# Altium schematic sheet 电路图.SchDoc
size A3
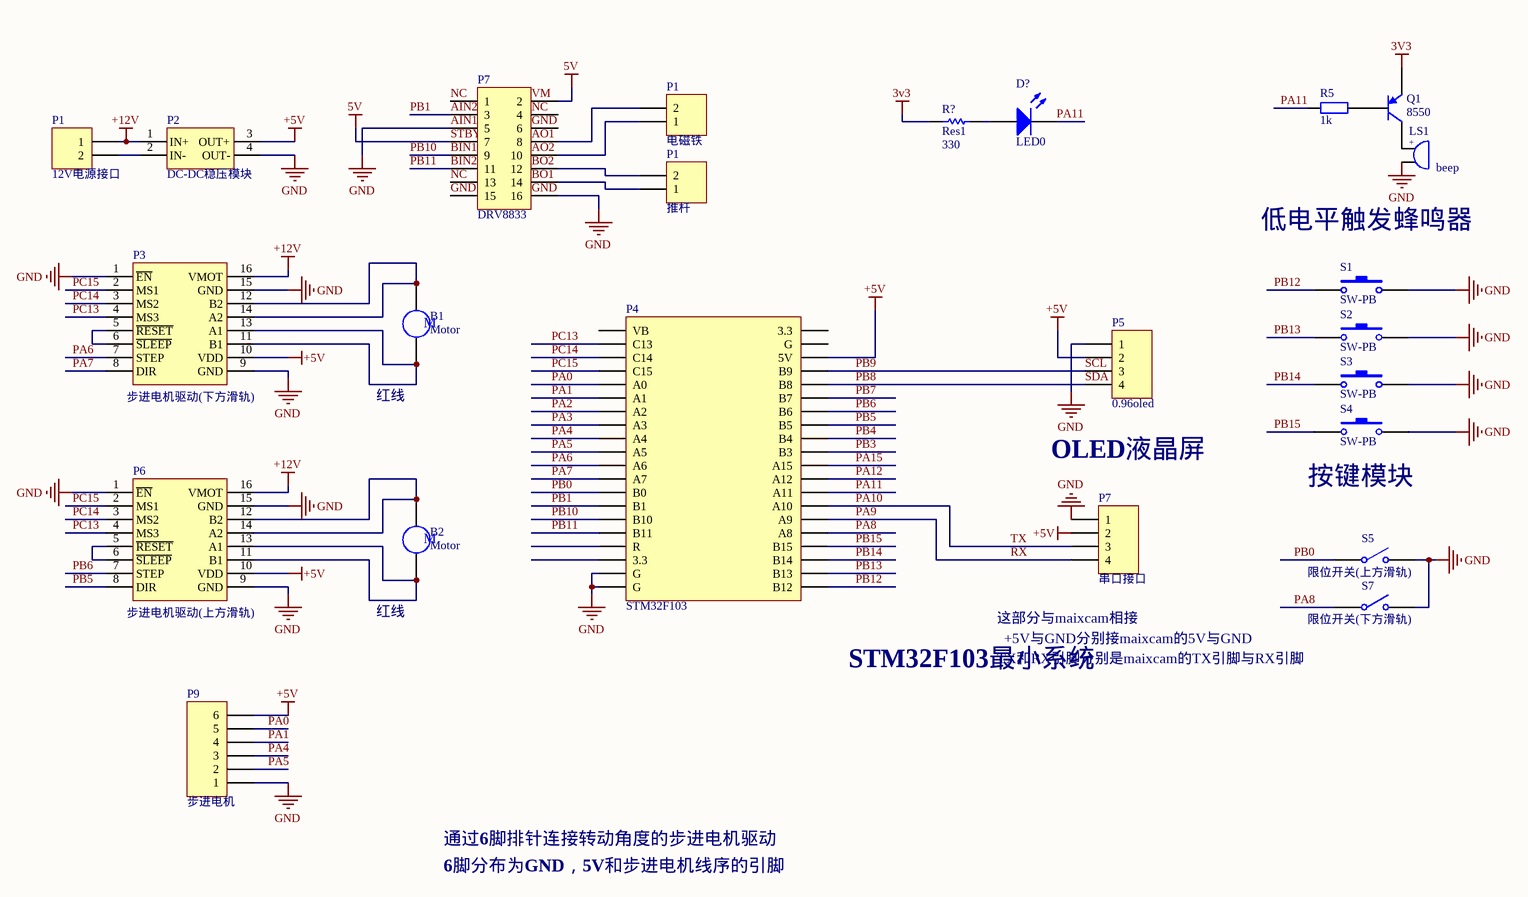
[diagram p0: 电路图.SchDoc]

## Parts
(Parts that share a designator on the sheet are numbered #1, #2 ... from top to bottom, then left to right.)
B1  Motor  [RB5-10.5]
B2  Motor  [RB5-10.5]
D?  LED0  [LED-0]
LS1  beep  [BEEP 5x9x5.5]
P1#1  12V电源接口  [HDR1X2]
P1#2  电磁铁  [HDR1X2]
P1#3  推杆  [HDR1X2]
P2  DC-DC稳压模块
P3  步进电机驱动(下方滑轨)
P4  STM32F103  [HDR2X20]
P5  0.96oled  [HDR1X4]
P6  步进电机驱动(上方滑轨)
P7#1  DRV8833  [HDR2X8H]
P7#2  串口接口  [HDR1X4]
P9  步进电机  [HDR1X6]
Q1  8550  [TO-92A]
R5  1k  [R 0805_L]
R?  Res1  value 330  [AXIAL-0.3]
S1  SW-PB  [SPST-2]
S2  SW-PB  [SPST-2]
S3  SW-PB  [SPST-2]
S4  SW-PB  [SPST-2]
S5  限位开关(上方滑轨)  [SMT-KEY]
S7  限位开关(下方滑轨)  [SMT-KEY]

## Nets
3v3: Q1.1(E) R?.1
+5V: P2.3(OUT+) P3.10(VDD) P4.35(5V) P5.2 P6.10(VDD) P7#2.2 P9.6
+12V: P1#1.1 P2.1(IN+) P3.16(VMOT) P6.16(VMOT)
AIN1: LS1.2 P2.4(OUT-) P3.1(~{EN}) P3.9(GND) P3.15(GND) P4.2(G) P4.4(G) P5.1 P6.1(~{EN}) P6.9(GND) P6.15(GND) P7#1.5 P7#1.15 P7#1.16 P7#2.1 P9.1 S1.1 S2.1 S3.1 S4.1 S5.2(NO) S7.2(NO)  [also labelled GND]
STBY: P7#1.2 P7#1.7  [also labelled 5V]
AIN2: P4.14(B1) P7#1.3  [also labelled PB1]
BIN1: P4.12(B10) P7#1.9  [also labelled PB10]
BIN2: P4.10(B11) P7#1.11  [also labelled PB11]
NC: P7#1.1 P7#1.13
PA0: P4.32(A0) P9.5
PA1: P4.30(A1) P9.4
PA2: P4.28(A2)
PA3: P4.26(A3)
PA4: P4.24(A4) P9.3
PA5: P4.22(A5) P9.2
PA6: P3.7(STEP) P4.20(A6)
PA7: P3.8(DIR) P4.18(A7)
PA8: P4.9(A8) S7.1(COMMON)
PA9: P4.11(A9) P7#2.4  [also labelled RX]
PA10: P4.13(A10) P7#2.3  [also labelled TX]
PA11: D?.2(K) P4.15(A11) R5.1
PA12: P4.17(A12)
PA15: P4.19(A15)
PB0: P4.16(B0) S5.1(COMMON)
PB3: P4.21(B3)
PB4: P4.23(B4)
PB5: P4.25(B5) P6.8(DIR)
PB6: P4.27(B6) P6.7(STEP)
PB7: P4.29(B7)
PB8: P4.31(B8) P5.4  [also labelled SDA]
PB9: P4.33(B9) P5.3  [also labelled SCL]
PB12: P4.B12 S1.2
PB13: P4.3(B13) S2.2
PB14: P4.5(B14) S3.2
PB15: P4.7(B15) S4.2
PC13: P3.4(MS3) P4.38(C13) P6.4(MS3)
PC14: P3.3(MS2) P4.36(C14) P6.3(MS2)
PC15: P3.2(MS1) P4.34(C15) P6.2(MS1)
NetB1_1: B1.1 P3.12(B2) P3.14(A2)
NetB1_2: B1.2 P3.11(B1) P3.13(A1)
NetB2_1: B2.1 P6.12(B2) P6.14(A2)
NetB2_2: B2.2 P6.11(B1) P6.13(A1)
NetD?_1: D?.1(A) R?.2
NetLS1_1: LS1.1 Q1.3(C)
NetP1#1_2: P1#1.2 P2.2(IN-)
NetP1#2_1: P1#2.1 P7#1.10
NetP1#2_2: P1#2.2 P7#1.8
NetP1#3_1: P1#3.1 P7#1.14
NetP1#3_2: P1#3.2 P7#1.12
NetP3_5: P3.5(~{RESET}) P3.6(~{SLEEP})
NetP6_5: P6.5(~{RESET}) P6.6(~{SLEEP})
NetQ1_2: Q1.2(B) R5.2

Not connected (* = marked no-connect by the designer): P4 6(3.3) 8(R) 37(G) 39(3.3) 40(VB); P7#1 4 6

## Notes on the sheet
- 低电平触发蜂鸣器
- 红线
- OLED液晶屏
- (near S4) 按键模块
- STM32F103最小系统
- (near P7#2) 这部分与maixcam相接
- TX和RX引脚分别是maixcam的TX引脚与RX引脚
- +5V与GND分别接maixcam的5V与GND
- 通过6脚排针连接转动角度的步进电机驱动
- 6脚分布为GND，5V和步进电机线序的引脚
- Labels drawn without touching a wire or pin: AO1, AO2, BO1, BO2, GND, NC, VM
- (in symbol BEEP) +
- (in symbol Motor) M

## Library data of the parts
B1 B2 = Motor: Motor, General Kind; Published: 24-Mar-1999; LatestRevisionDate: 17-Jul-2002; LatestRevisionNote: Re-released for DXP Platform.; PackageReference: RB5-10.5; Publisher: Altium Limited; PackageDescription: Capacitor (Radial); 2 Leads
D? = LED0: Typical INFRARED GaAs LED; Published: 8-Jun-2000; LatestRevisionDate: 08-Jul-2005; LatestRevisionNote: Mech Layer 1 removed.; PackageReference: LED-0; Publisher: Altium Limited; PackageDescription: LED; 2 Leads
LS1 = BEEP: 蜂鸣器; 版权归属: 封装库来自淘宝 ID：黄晶宝石; BOM名称: 蜂鸣器; 联系售后: https://shop463601444.taobao.com
P1#1-P1#3 = Header 2: Header, 2-Pin; LatestRevisionDate: 17-Jul-2002; LatestRevisionNote: Re-released for DXP Platform.; Publisher: Altium Limited
P3 P6 = 步进电机驱动
P4 = Header 20X2: Header, 20-Pin, Dual row; LatestRevisionDate: 17-Jul-2002; LatestRevisionNote: Re-released for DXP Platform.; Publisher: Altium Limited
P5 P7#2 = Header 4: Header, 4-Pin; LatestRevisionDate: 17-Jul-2002; LatestRevisionNote: Re-released for DXP Platform.; Publisher: Altium Limited
P7#1 = Header 8X2H: Header, 8-Pin, Dual row, Right Angle; LatestRevisionDate: 17-Jul-2002; LatestRevisionNote: Re-released for DXP Platform.; Publisher: Altium Limited
P9 = Header 6: Header, 6-Pin; LatestRevisionDate: 17-Jul-2002; LatestRevisionNote: Re-released for DXP Platform.; Publisher: Altium Limited
Q1 = 2N3906: PNP General Purpose Amplifier; Published: 8-Jun-2000; LatestRevisionDate: 15-Jan-2003; LatestRevisionNote: PCB Footprint 'BCY-W3/D4.7' replaced; DatasheetVersion: 1997; PackageVersion: Sep-1998; PackageReference: TO-92A; Publisher: Altium Limited; PackageDescription: TO, Flat Index; 3 In-Line, Axial Leads; Body Dia. 4.5mm; Leads 0.51 x 0.48 mm (max); ComponentLink1Description: Manufacturer Link; ComponentLink1URL: http://www.fairchildsemi.com/; ComponentLink2Description: Datasheet; ComponentLink2URL: http://www.fairchildsemi.com/ds/2N%2F2N3906.pdf
R5 = R: 贴片电阻; 版权归属: 来自淘宝 ID：黄晶宝石; BOM名称: 贴片电阻; 联系售后: https://shop463601444.taobao.com
R? = Res1: Resistor; Published: 8-Jun-2000; LatestRevisionDate: 17-Jul-2002; LatestRevisionNote: Re-released for DXP Platform.; PackageReference: AXIAL-0.3; Publisher: Altium Limited; PackageDescription: Axial Device, Thru-Hole; 2 Leads; 0.3 in Pin Spacing
S1-S4 = SW-PB: Switch; Published: 24-Mar-1999; LatestRevisionDate: 17-Jul-2002; LatestRevisionNote: Re-released for DXP Platform.; PackageReference: SPST-2; Publisher: Altium Limited; PackageDescription: Switch; 2 Leads
S5 S7 = SW-SPST: Single-Pole, Single-Throw Switch